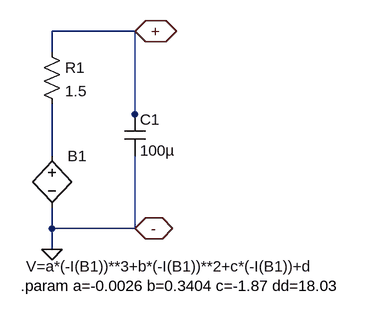
[diagram p0: schematic test.asc]
test.asc, the LTspice schematic file:
Version 4.1
SHEET 1 4760 680
WIRE -128 -112 -256 -112
WIRE -256 -80 -256 -112
WIRE -128 16 -128 -112
WIRE -128 32 -128 16
WIRE -256 80 -256 0
WIRE -256 192 -256 160
WIRE -128 192 -128 80
WIRE -128 192 -256 192
WIRE -256 224 -256 192
FLAG -256 224 0
FLAG -128 -112 +
IOPIN -128 -112 BiDir
FLAG -128 192 -
IOPIN -128 192 BiDir
SYMBOL bv -256 64 R0
WINDOW 3 -40 186 Left 2
SYMATTR Value V=a*(-I(B1))**3+b*(-I(B1))**2+c*(-I(B1))+d
SYMATTR InstName B1
SYMBOL res -272 -96 R0
SYMATTR InstName R1
SYMATTR Value 1.5
SYMBOL cap -144 16 R0
SYMATTR InstName C1
SYMATTR Value 100µ
TEXT -304 280 Left 2 !.param a=-0.0026 b=0.3404 c=-1.87 dd=18.03

The netlist it stands for:
* test.asc
B1 N001 0 V=a*(-I(B1))**3+b*(-I(B1))**2+c*(-I(B1))+d
R1 + N001 1.5
C1 + 0 100µ
.param a=-0.0026 b=0.3404 c=-1.87 dd=18.03
.backanno
.end